# Altium schematic sheet PressureAirflow.SchDoc: Pressão e fluxo de ar
size 420 x 297 mm; Author: Matheus Markies; DrawnBy: Matheus Markies; Engineer: Matheus Markies; DocumentNumber: ECTU-SCH-07; Revision: A definir; SheetNumber: 7; SheetTotal: 12; ProjectTitle: ROUTE ECU / ECTU; DocumentStatus: Em desenvolvimento; DocumentDate: 14/10/2026
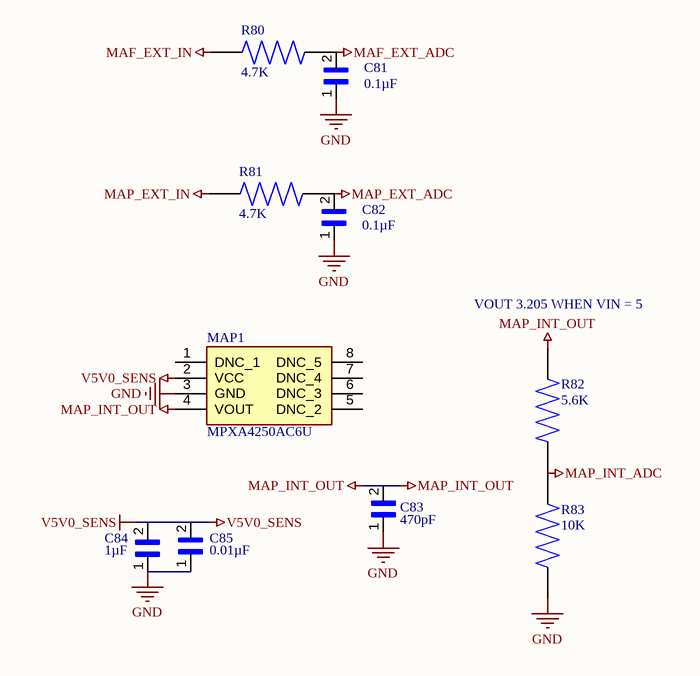
[diagram p0: PressureAirflow.SchDoc]

## Parts
C81  0.1µF  [CAPC1608X90N]
C82  0.1µF  [CAPC1608X90N]
C83  470pF  [CAPC1608X90N]
C84  1µF  [CAPC1608X90N]
C85  0.01µF  [CAPC1608X90N]
MAP1  MPXA4250AC6U  [SOP254P1821X1321-8N]
R80  4.7K  [RESC3116X65N]
R81  4.7K  [RESC3116X65N]
R82  5.6K  [RESC3116X65N]
R83  10K  [RESC3116X65N]

## Nets
GND: C81.1 C82.1 C83.1 C84.1 C85.1 MAP1.3(GND) R83.1
MAF_EXT_ADC: C81.2 R80.1
MAF_EXT_IN: R80.2
MAP_EXT_ADC: C82.2 R81.1
MAP_EXT_IN: R81.2
MAP_INT_ADC: R82.2 R83.2
MAP_INT_OUT: C83.2 MAP1.4(VOUT) R82.1
V5V0_SENS: C84.2 C85.2 MAP1.2(VCC)

Not connected (* = marked no-connect by the designer): MAP1 1(DNC_1) 5(DNC_2) 6(DNC_3) 7(DNC_4) 8(DNC_5)

## Notes on the sheet
- VOUT 3.205 WHEN VIN = 5
- PROJETO
- STATUS
- FOLHA / SUBSISTEMA
- AUTOR
- CÓDIGO DO DESENHO
- ARQUIVO
- ATUALIZAÇÃO
- REVISÃO
- FOLHA
- FORMATO
- A3
- /

## Library data of the parts
C81-C85 = 06035C104MAZ2A: Multilayer Ceramic Capacitors MLCC - SMD/SMT; Package: None; Price: None; Value: *; MP: 06035C104MAZ2A; Availability: Unavailable
MAP1 = MPXA4250AC6U: Undefined or Miscellaneous; Manufacturer_Name: NXP; Datasheet Link: http://www.nxp.com/docs/en/data-sheet/MPX4250A.pdf; Height: 13.21mm; Manufacturer_Part_Number: MPXA4250AC6U; Mouser Part Number: 841-MPXA4250AC6U; Mouser Price/Stock: https://www.mouser.co.uk/ProductDetail/NXP-Semiconductors/MPXA4250AC6U?qs=r8OyiFxb6ReTWAhl%252B7c3ZA%3D%3D; Arrow Part Number: MPXA4250AC6U; Arrow Price/Stock: https://www.arrow.com/en/products/mpxa4250ac6u/nxp-semiconductors?region=nac
R80 R81 = RC1206FR-074K7L: 4.7 kOhms Â±1% 0.25W, 1/4W Chip Resistor 1206 (3216 Metric) Moisture Resistant Thick Film; MF: Yageo; SnapEDA_Link: https://www.snapeda.com/parts/RC1206FR-074K7L/Yageo/view-part/?ref=snap; Package: 3116 Yageo; Value: *; MP: RC1206FR-074K7L; Check_prices: https://www.snapeda.com/parts/RC1206FR-074K7L/Yageo/view-part/?ref=eda
R82 R83 = AA1206JR-07470RL: Package: None; Price: None; Value: *; MP: AA1206JR-07470RL; Availability: Unavailable